# EasyEDA Pro project 模块拓展版_2026-11-20.epro

# Schematic Schematic2
Assembly Variant: Basic; Board Name: Board2; Create Date: 2026-11-12; Page Name: P1; Project Name: 拓展版; Schematic Name: Schematic2; Update Date: 2026-11-12; Company: 嘉立创EDA; Page Size: A4; Version: V1.0
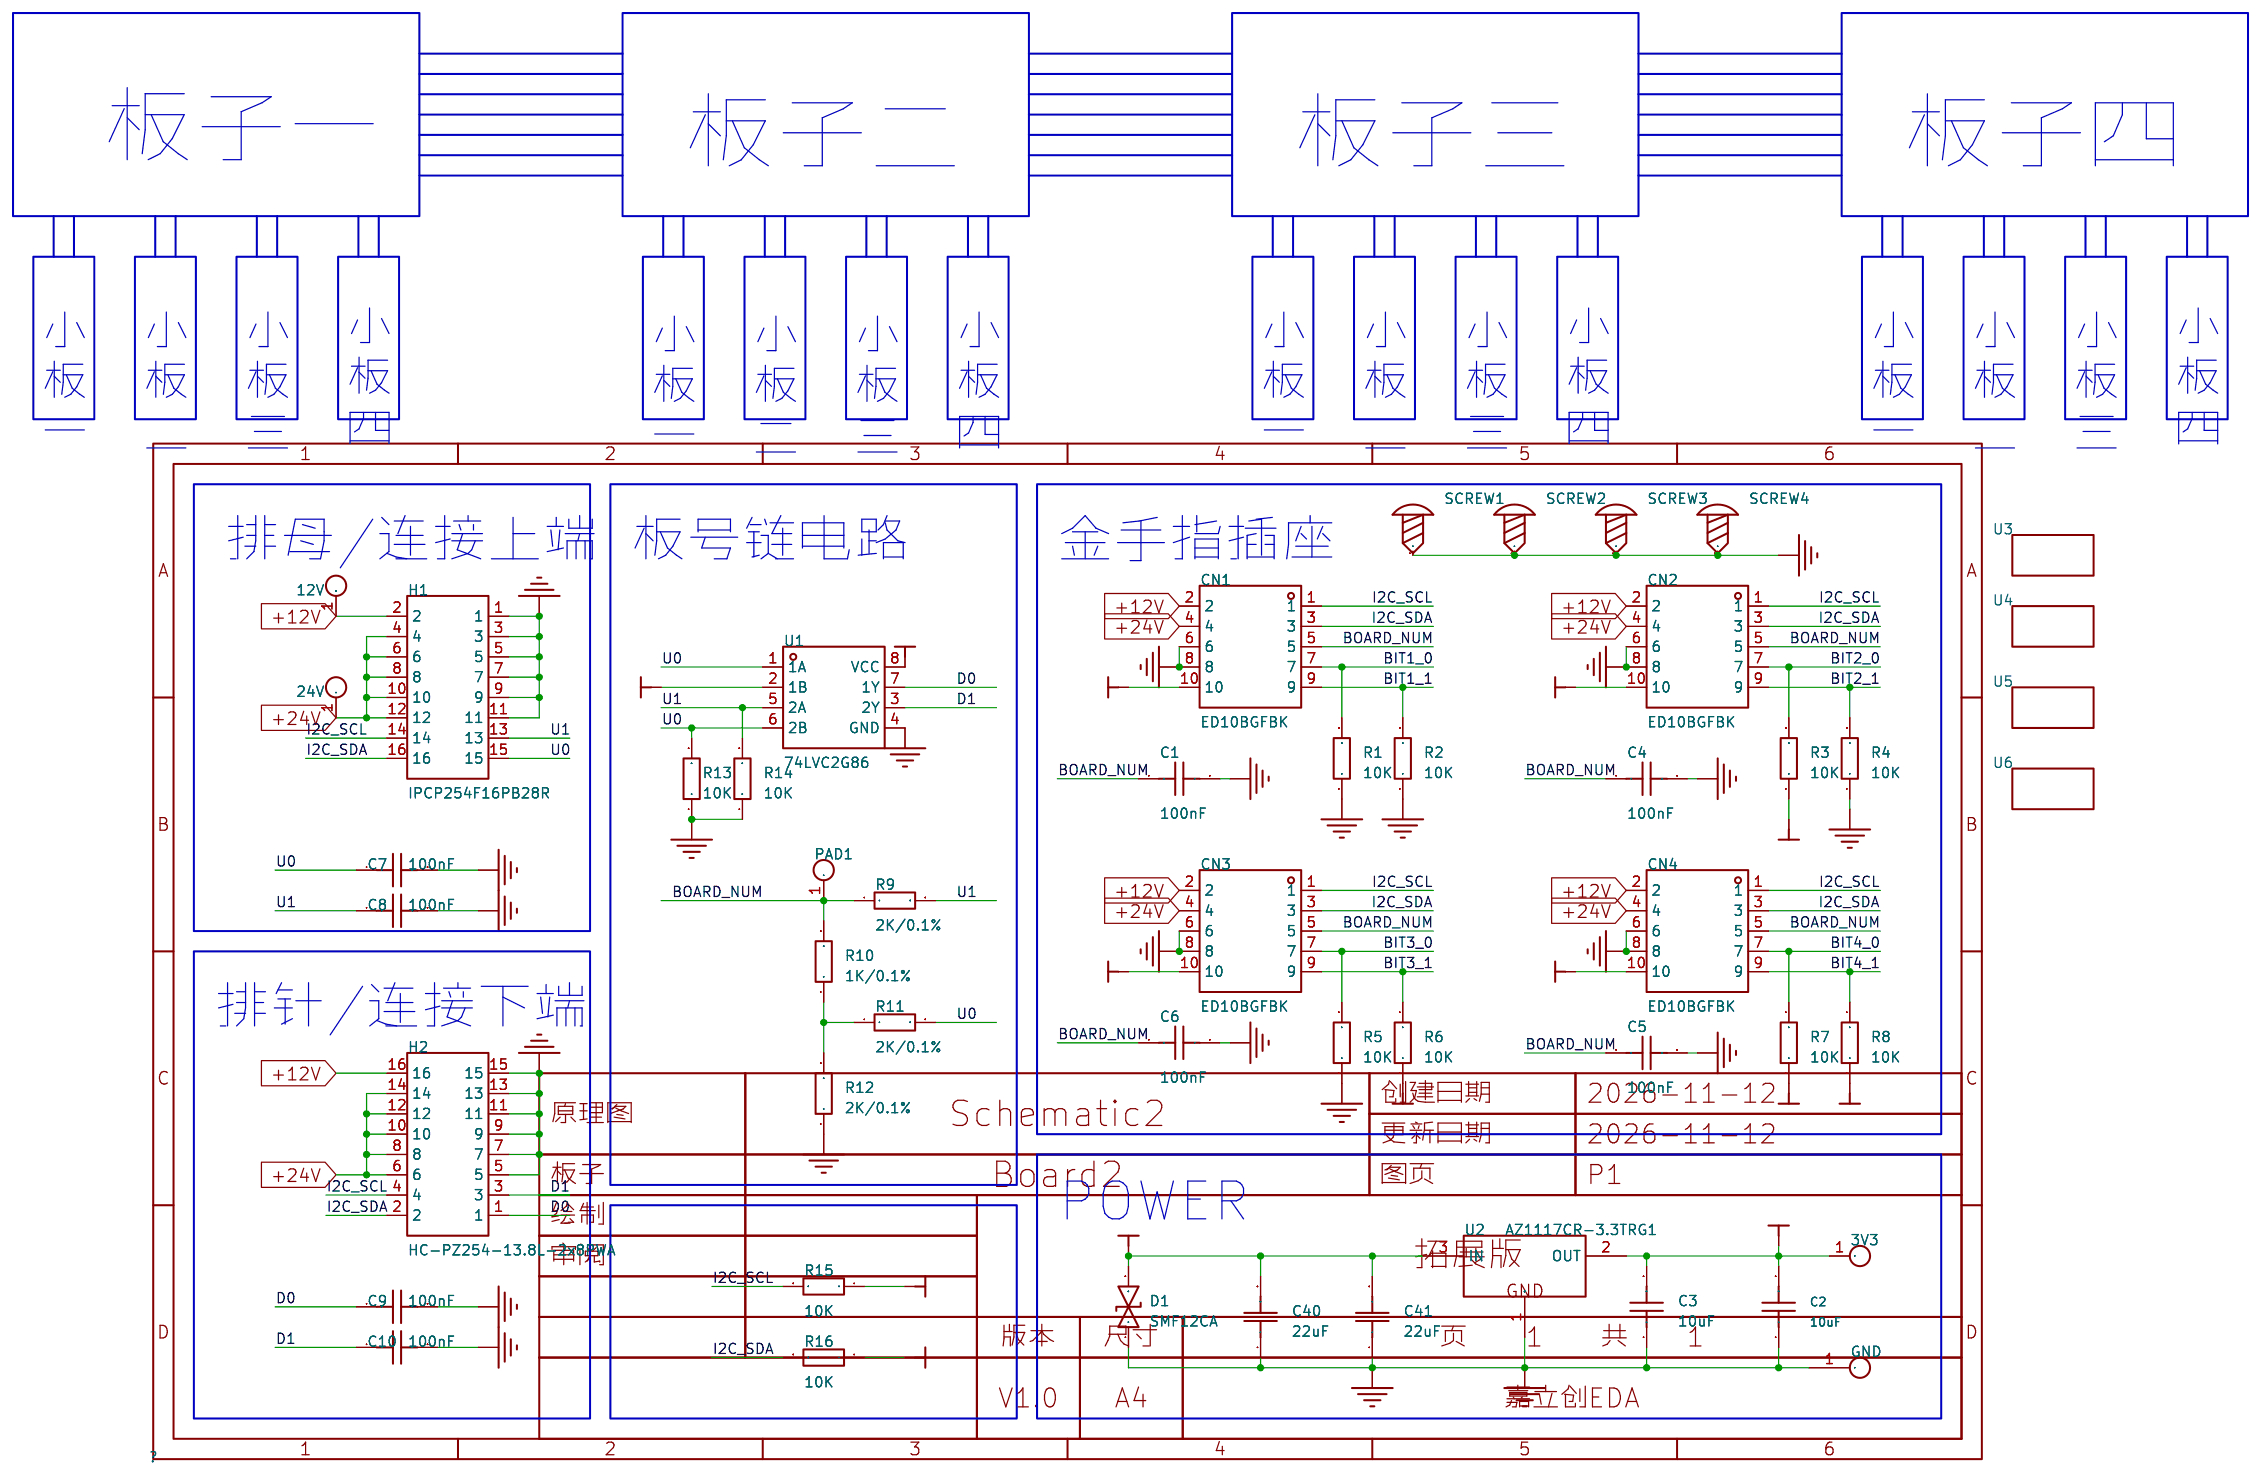
[diagram p0: schematic sheet]

## Parts
3V3  -  [test_point]
12V  -  [test_point]
24V  -  [test_point]
C1  100nF  [C1206]
C2  10uF  [C1206]
C3  10uF  [C1206]
C4  100nF  [C1206]
C5  100nF  [C1206]
C6  100nF  [C1206]
C7  100nF  [C1206]
C8  100nF  [C1206]
C9  100nF  [C1206]
C10  100nF  [C1206]
C40  22uF  [C1206]
C41  22uF  [C1206]
CN1  ED10BGFBK  [CONN-TH_10P-P2.54_ED10BGFBK]
CN2  ED10BGFBK  [CONN-TH_10P-P2.54_ED10BGFBK]
CN3  ED10BGFBK  [CONN-TH_10P-P2.54_ED10BGFBK]
CN4  ED10BGFBK  [CONN-TH_10P-P2.54_ED10BGFBK]
D1  SMF12CA  [SOD-123FL_L2.8-W1.8-LS3.7-BI]
GND  -  [test_point]
H1  IPCP254F16PB28R  [HDR-TH_16P-P2.54-H-F-R2-C8-S2.54-W10.2]
H2  HC-PZ254-13.8L-2x8PWA  [HDR-TH_16P-P2.54-V-M-R2-C8-S2.54-N13.0]
PAD1  -  [test_point]
R1  10K  [R1206]
R2  10K  [R1206]
R3  10K  [R1206]
R4  10K  [R1206]
R5  10K  [R1206]
R6  10K  [R1206]
R7  10K  [R1206]
R8  10K  [R1206]
R9  2K/0.1%  [R1206]
R10  1K/0.1%  [R1206]
R11  2K/0.1%  [R1206]
R12  2K/0.1%  [R1206]
R13  10K  [R1206]
R14  10K  [R1206]
R15  10K  [R1206]
R16  10K  [R1206]
SCREW1  -  [M3螺丝]
SCREW2  -  [M3螺丝]
SCREW3  -  [M3螺丝]
SCREW4  -  [M3螺丝]
U1  74LVC2G86  [MSOP-8_L2.9-W2.8-P0.65-LS4.0-BR]
U2  AZ1117CR-3.3TRG1  [SOT-89-3_L4.5-W2.5-P1.50-LS4.2-BR]
U3  -  [轮廓]
U4  -  [轮廓]
U5  -  [轮廓]
U6  -  [轮廓]

## Library data of the parts
3V3 12V 24V GND = 测试点: Check: false
C1 C4-C10 = CAP_0603: Supplier Footprint: 0603
C2 = CC0603KRX7R9BB104: 容值:100nF;精度:±10%;额定电压:50V;温度系数:X7R;; LCSC Part Name: 100nF ±10% 50V; Supplier Part: C14663; Manufacturer: YAGEO(国巨); Supplier Footprint: 0603; JLCPCB Part Class: Basic Part; Datasheet: https://item.szlcsc.com/datasheet/CC0603KRX7R9BB104/15331.html; Supplier: LCSC; Tolerance: ±10%; Voltage Rating: 50V; Temperature Coefficient: X7R
C3 C41 = CL10A106KP8NNNC: 容值:10uF;精度:±10%;额定电压:10V;温度系数:X5R;; LCSC Part Name: 10uF ±10% 10V; Supplier Part: C19702; Manufacturer: SAMSUNG(三星); Supplier Footprint: 0603; JLCPCB Part Class: Basic Part; Datasheet: https://item.szlcsc.com/datasheet/CL10A106KP8NNNC/20411.html; Supplier: LCSC; Tolerance: ±10%; Voltage Rating: 10V; Temperature Coefficient: X5R
C40 = CL10A226MQ8NRNC: 容值:22uF;精度:±20%;额定电压:6.3V;温度系数:X5R;; LCSC Part Name: 22uF ±20% 6.3V; Supplier Part: C59461; Manufacturer: SAMSUNG(三星); Supplier Footprint: 0603; JLCPCB Part Class: Basic Part; Datasheet: https://item.szlcsc.com/datasheet/CL10A226MQ8NRNC/60514.html; Supplier: LCSC; Tolerance: ±20%; Voltage Rating: 6.3V; Temperature Coefficient: X5R
CN1-CN4 = ED10BGFBK: 间距:2.54mm;总PIN数:10P;安装方式:直插;工作温度:-55℃~+125℃;; LCSC Part Name: 2.54mm P数:10P; Supplier Part: C5173289; Manufacturer: WingTAT(格林柏); Supplier Footprint: 插件,P=2.54mm; JLCPCB Part Class: Extended Part; Datasheet: https://item.szlcsc.com/datasheet/ED10BGFBK/5822872.html; Supplier: LCSC; Pitch: 2.54mm; Number of Pins: 10P; Mounting Type: 直插; Height Above Board: 15.6mm; Contact Material: 铜合金; Contact Plating: 金; Operating Temperature: -55℃~+125℃; Rated Current: 3A; Length: 18.99mm; Width: 9.25mm
D1 = SMF12CA_C19077507: 极性:双向;反向截止电压(Vrwm):12V;钳位电压:19.9V;峰值脉冲电流(Ipp):10.1A@10/1000us;峰值脉冲功率(Ppp):200W@10/1000us;击穿电压(VBR):14.7V;; LCSC Part Name: 双向TVS 12V截止 峰值浪涌电流：10.1A@10/1000us; Supplier Part: C19077507; Manufacturer: R+O(宏嘉诚); Supplier Footprint: SOD-123FL; JLCPCB Part Class: Extended Part; Datasheet: https://item.szlcsc.com/datasheet/SMF12CA/20275592.html; Supplier: LCSC; Polarity: 双向; Reverse Stand-Off Voltage (Vrwm): 12V; Clamping Voltage: 19.9V; Peak Pulse Current (Ipp): 10.1A@10/1000us; Peak Pulse Power Dissipation (Ppp): 200W@10/1000us; Voltage - Breakdown: 14.7V; Reverse Leakage Current (Ir): 2.5uA; Number of Channels: 单路; Operating Temperature: -55℃~+150℃; level of protection: IEC 61000-4-2; Type: TVS
H1 = IPCP254F16PB28R: 插孔结构:2x8P;间距:2.54mm;圆孔/方孔:方孔;安装方式:弯插;排数:双排;总孔位数:16P;额定电流:3A;额定电压:-;插孔方向:侧面;塑高:5mm;触头材质:黄铜;触头镀层:金;工作温度:-40℃~+105℃;; LCSC Part Name: 2x8P 间距:2.54mm 弯插; Supplier Part: C22438457; Manufacturer: INCP; Supplier Footprint: 弯插,P=2.54mm; JLCPCB Part Class: Extended Part; Datasheet: https://item.szlcsc.com/datasheet/IPCP254F16PB28R/24076646.html; Supplier: LCSC; Holes Structure: 2x8P; Pitch: 2.54mm; Circular Hole / Square Hole: 方孔; Mounting Type: 弯插; Number of Rows: 双排; Number of Positions: 16P; Current Rating: 3A; Holes Direction: 侧面; Insulation Height: 5mm; Contact Material: 黄铜; Contact Plating: 金; Operating Temperature: -40℃~+105℃
H2 = HC-PZ254-13.8L-2x8PWA: 插针结构:2x8P;间距:2.54mm;行距:2.54mm;圆针/方针:方针;安装方式:弯插;排数:双排;总PIN位数:16P;额定电流:3A;额定电压:-;配合针长度:6mm;塑高:2.5mm;端接针长度:3mm;触头材质:黄铜;触头镀层:金;工作温度:-40℃~+105℃;颜色:黑色;; LCSC Part Name: 2x8P 间距:2.54mm 方针 弯插; Supplier Part: C27985210; Manufacturer: HC(虹成电子); Supplier Footprint: 弯插,P=2.54mm; JLCPCB Part Class: Extended Part; Datasheet: https://item.szlcsc.com/datasheet/HC-PZ254-13.8L-2x8PWA/29721168.html; Supplier: LCSC; Pin Structure: 2x8P; Pitch: 2.54mm; Row Spacing: 2.54mm; Circluar Pins/Square Pins: 方针; Mounting Type: 弯插; Number of Rows: 双排; Number of Pins: 16P; Current Rating: 3A; Length of Mating Pin: 6mm; Insulation Height: 2.5mm; Length of End Connection Pin: 3mm; Contact Material: 黄铜; Contact Plating: 金; Operating Temperature: -40℃~+105℃; Color: 黑色
PAD1 = 测试点
R1-R16 = Res_0603: Supplier Footprint: 0603
SCREW1-SCREW4 = M3螺丝: Supplier Footprint: 插件
U1 = SN74LVC2G86DCUR: 逻辑类型:异或门;门电路数量:2;工作电压:1.65V~5.5V;静态电流(Iq):10uA;传播延迟(tpd):4.7ns@3.3V;; LCSC Part Name: 双通道2输入异或门; Supplier Part: C507252; Manufacturer: TI(德州仪器); Supplier Footprint: VSSOP-8; JLCPCB Part Class: Extended Part; Datasheet: https://www.ti.com/cn/lit/ds/symlink/sn74lvc2g86.pdf; Supplier: LCSC; Logic Type: 异或门; Number of Gates: 2; Voltage - Supply: 1.65V~5.5V; Quiescent Current: 10uA; Current - Output Low(IOL): 32mA; Current - Output High(IOH): 32mA; Input Logic Level - High: 2V；1.7V; Input Logic Level - Low: 800mV；700mV; Output Logic Level - High: 3.8V；1.9V；2.4V；2.3V；1.2V; Output Logic Level - Low: 300mV；400mV；450mV；550mV; Series: 74LVC; Propagation Delay: 4.7ns@3.3V; Operating Temperature: -40℃~+125℃; Inputs per Gates: 2; Features: 局部关断模式；带电插入保护；后驱动保护
U2 = AZ1117CR-3.3TRG1: 输出极性:正极;工作电压:15V;输出电压:3.3V;输出电流:800mA;电源纹波抑制比(PSRR):70dB@(120Hz);输出类型:固定;; LCSC Part Name: 3.3V 800mA 15V; Supplier Part: C460428; Manufacturer: DIODES(美台); Supplier Footprint: SOT-89; JLCPCB Part Class: Extended Part; Datasheet: https://item.szlcsc.com/datasheet/AZ1117CR-3.3TRG1/464857.html; Supplier: LCSC; Output Configuration: 正极; Voltage - Supply: 15V; Output Voltage: 3.3V; Output Current: 800mA; Power Supply Rejection Ratio (PSRR): 70dB@(120Hz); Voltage Dropout: 1.3V@(800mA); standby current: 6mA; Noise: 0.003%Vout; Features: 过流保护；热关断; Operating Temperature: -20℃~+125℃@(Tj); Output Type: 固定; Number of Outputs: 1
U3-U6 = 轮廓

## Nets
3V3: 3V3.1 C2.2 C3.2 CN1.10 CN2.10 CN3.10 CN4.10 R3.1 R6.1 R7.1 R8.1 R15.1 R16.1 U1.2(1B) U1.8(VCC) U2.2(OUT)
+12V: 12V.1 C40.2 C41.2 CN1.2 CN2.2 CN3.2 CN4.2 D1.2 H1.2 H2.16 U2.3(IN)
+24V: 24V.1 CN1.4 CN2.4 CN3.4 CN4.4 H1.4 H1.6 H1.8 H1.10 H1.12 H2.6 H2.8 H2.10 H2.12 H2.14
GND: C1.2 C2.1 C3.1 C4.2 C5.2 C6.2 C7.2 C8.2 C9.2 C10.2 C40.1 C41.1 CN1.6 CN1.8 CN2.6 CN2.8 CN3.6 CN3.8 CN4.6 CN4.8 D1.1 GND.1 H1.1 H1.3 H1.5 H1.7 H1.9 H1.11 H2.5 H2.7 H2.9 H2.11 H2.13 H2.15 R1.1 R2.1 R4.1 R5.1 R12.1 R13.1 R14.1 SCREW1.1 SCREW2.1 SCREW3.1 SCREW4.1 U1.4(GND) U2.1(GND)
BIT1_0: CN1.7 R1.2
BIT1_1: CN1.9 R2.2
BIT2_0: CN2.7 R3.2
BIT2_1: CN2.9 R4.2
BIT3_0: CN3.7 R5.2
BIT3_1: CN3.9 R6.2
BIT4_0: CN4.7 R7.2
BIT4_1: CN4.9 R8.2
BOARD_NUM: C1.1 C4.1 C5.1 C6.1 CN1.5 CN2.5 CN3.5 CN4.5 PAD1.1 R9.1 R10.2
D0: C9.1 H2.1 U1.7(1Y)
D1: C10.1 H2.3 U1.3(2Y)
I2C_SCL: CN1.1 CN2.1 CN3.1 CN4.1 H1.14 H2.4 R15.2
I2C_SDA: CN1.3 CN2.3 CN3.3 CN4.3 H1.16 H2.2 R16.2
U0: C7.1 H1.15 R11.2 R13.2 U1.1(1A) U1.6(2B)
U1: C8.1 H1.13 R9.2 R14.2 U1.5(2A)
$1N96: R10.1 R11.1 R12.2

## Notes on the sheet
- 板子一
- 板子二
- 板子三
- 板子四
- 小
  板
  一
- 小
  板
  二
- 小
  板
  三
- 小
  板
  四
- 小
  板
  一
- 小
  板
  二
- 小
  板
  三
- 小
  板
  四
- 小
  板
  一
- 小
  板
  二
- 小
  板
  三
- 小
  板
  四
- 小
  板
  一
- 小
  板
  二
- 小
  板
  三
- 小
  板
  四
- 排母/连接上端
- 板号链电路
- 金手指插座
- 排针/连接下端
- POWER

# Schematic Schematic1
Assembly Variant: Basic; Board Name: Board1; Create Date: 2026-11-12; Page Name: P1; Project Name: 拓展版; Schematic Name: Schematic1; Update Date: 2026-11-12; Company: 嘉立创EDA; Page Size: A4; Version: V1.0
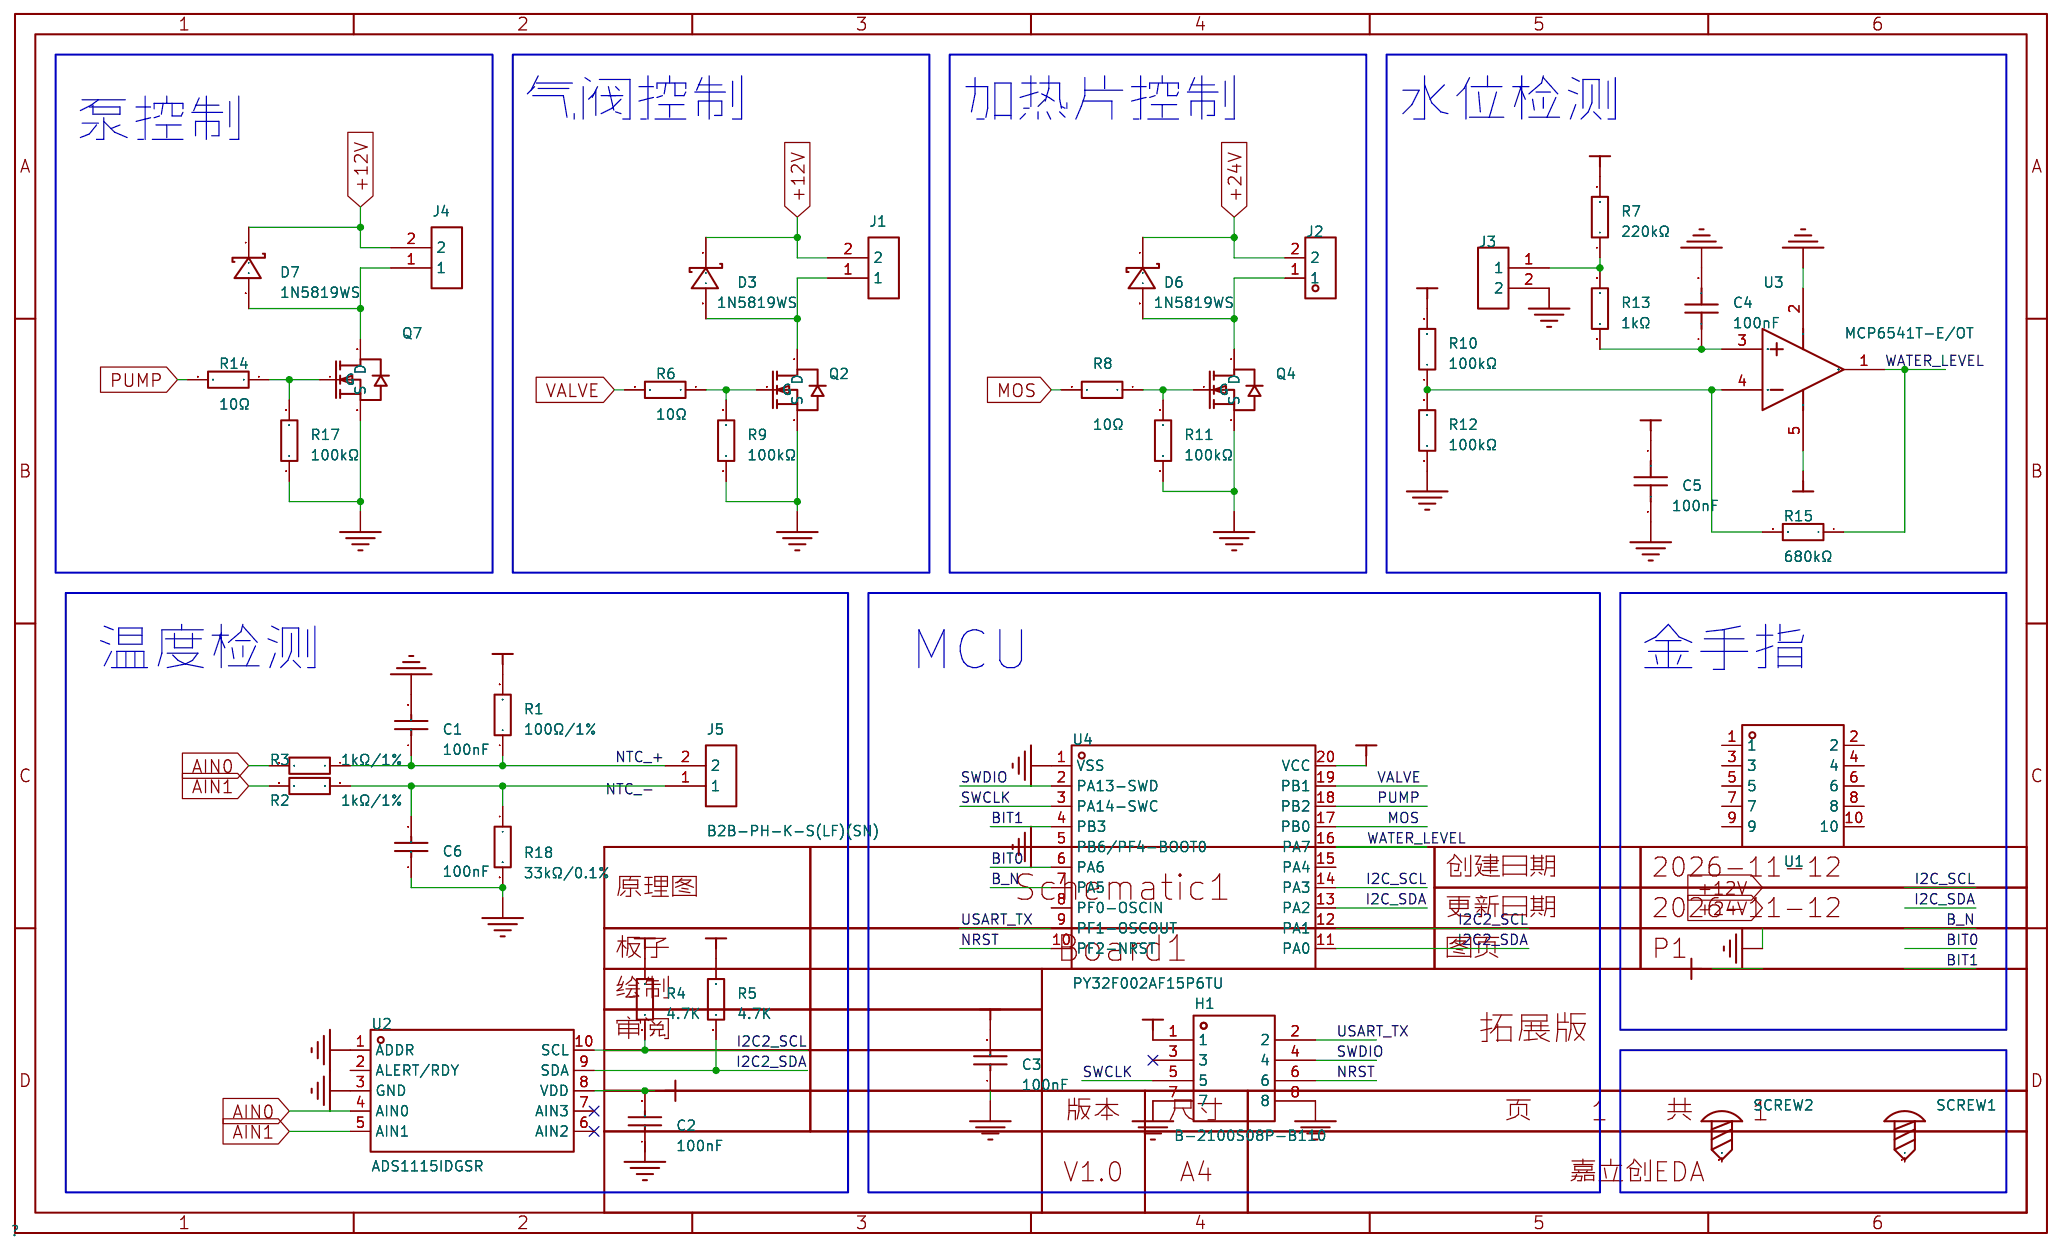
[diagram p1: schematic sheet]

## Parts
C1  100nF  [C0603]
C2  100nF  [C0603]
C3  100nF  [C0603]
C4  100nF  [C0603]
C5  100nF  [C0603]
C6  100nF  [C0603]
D3  1N5819WS  [SOD-323_L1.8-W1.3-LS2.5-RD]
D6  1N5819WS  [SOD-323_L1.8-W1.3-LS2.5-RD]
D7  1N5819WS  [SOD-323_L1.8-W1.3-LS2.5-RD]
H1  B-2100S08P-B110  [HDR-TH_8P-P2.54-V-M-R2-C4-S2.54]
J1  B2B-PH-K-S(LF)(SN)  [CONN-TH_B2B-PH-K-S]
J2  B2B-XH-A(LF)(SN)  [CONN-TH_B2B-XH-A-LF-SN]
J3  B2B-PH-K-S(LF)(SN)  [CONN-TH_B2B-PH-K-S]
J4  B2B-PH-K-S(LF)(SN)  [CONN-TH_B2B-PH-K-S]
J5  B2B-PH-K-S(LF)(SN)  [CONN-TH_B2B-PH-K-S]
Q2  -  [SOT-23-3_L2.9-W1.3-P1.90-LS2.4-BR]
Q4  -  [SOT-23-3_L2.9-W1.3-P1.90-LS2.4-BR]
Q7  -  [SOT-23-3_L2.9-W1.3-P1.90-LS2.4-BR]
R1  100Ω/1%  [R0603]
R2  1kΩ/1%  [R0603]
R3  1kΩ/1%  [R0603]
R4  4.7K  [R0603]
R5  4.7K  [R0603]
R6  10Ω  [R0603]
R7  220kΩ  [R0603]
R8  10Ω  [R0603]
R9  100kΩ  [R0603]
R10  100kΩ  [R0603]
R11  100kΩ  [R0603]
R12  100kΩ  [R0603]
R13  1kΩ  [R0603]
R14  10Ω  [R0603]
R15  680kΩ  [R0603]
R17  100kΩ  [R0603]
R18  33kΩ/0.1%  [R0603]
SCREW1  -  [M2螺丝]
SCREW2  -  [M2螺丝]
U1  -  [金手指]
U2  ADS1115IDGSR  [MSOP-10_L3.0-W3.0-P0.50-LS5.0-BL]
U3  MCP6541T-E/OT  [SOT-23-5_L2.9-W1.6-P0.95-LS2.8-BR]
U4  PY32F002AF15P6TU  [TSSOP-20_L6.5-W4.4-P0.65-LS6.4-BL]

## Library data of the parts
C1-C3 C6 = CL10B102KB8NNNC: 容值:1nF;精度:±10%;额定电压:50V;温度系数:X7R;; LCSC Part Name: 1nF ±10% 50V; Supplier Part: C1588; Manufacturer: SAMSUNG(三星); Supplier Footprint: 0603; JLCPCB Part Class: Basic Part; Datasheet: https://item.szlcsc.com/datasheet/CL10B102KB8NNNC/1940.html; Supplier: LCSC; Tolerance: ±10%; Voltage Rating: 50V; Temperature Coefficient: X7R
C4 C5 = CAP_0603: Supplier Footprint: 0603
D3 D6 D7 = 1N5819WS_C191023: 正向压降(Vf):600mV@1A;直流反向耐压(Vr):40V;整流电流:1A;; LCSC Part Name: 电压:40V 电流:1A; Supplier Part: C191023; Manufacturer: Hottech(合科泰); Supplier Footprint: SOD-323; JLCPCB Part Class: Basic Part; Datasheet: https://item.szlcsc.com/datasheet/1N5819WS/213850.html; Supplier: LCSC; Voltage - Forward(Vf@If): 600mV@1A; Voltage - DC Reverse(Vr): 40V; Current - Rectified: 1A; Non-Repetitive Peak Forward Surge Current: 25A
H1 = B-2100S08P-B110: 插针结构:2x4P;间距:2.54mm;行距:2.54mm;圆针/方针:方针;安装方式:直插;排数:双排;总PIN位数:8P;额定电流:3A;额定电压:-;配合针长度:6mm;塑高:2.54mm;端接针长度:3mm;触头材质:黄铜;触头镀层:金;工作温度:-40℃~+105℃;颜色:黑色;; LCSC Part Name: 2x4P 间距:2.54mm 方针 直插; Supplier Part: C124386; Manufacturer: Ckmtw(灿科盟); Supplier Footprint: 插件,P=2.54mm; JLCPCB Part Class: Extended Part; Datasheet: https://item.szlcsc.com/datasheet/B-2100S08P-B110/125661.html; Supplier: LCSC; Pin Structure: 2x4P; Pitch: 2.54mm; Row Spacing: 2.54mm; Circluar Pins/Square Pins: 方针; Mounting Type: 直插; Number of Rows: 双排; Number of Pins: 8P; Current Rating: 3A; Length of Mating Pin: 6mm; Insulation Height: 2.54mm; Length of End Connection Pin: 3mm; Contact Material: 黄铜; Contact Plating: 金; Operating Temperature: -40℃~+105℃; Color: 黑色
J1 J3-J5 = B2B-PH-K-S(LF)(SN): 插针结构:1x2P;间距:2mm;安装方式:直插;参考系列:PH;总PIN数:2P;排数:1;每排PIN数:2;行距:-;额定电流:2A;触头材质:黄铜;触头镀层:锡;工作温度:-25℃~+85℃;; LCSC Part Name: 1x2P 间距:2mm 直插 系列:PH; Supplier Part: C131337; Manufacturer: JST; Supplier Footprint: 插件,P=2mm; JLCPCB Part Class: Extended Part; Datasheet: https://item.szlcsc.com/datasheet/B2B-PH-K-S(LF)(SN)/142630.html; Supplier: LCSC; Pins Structure: 1x2P; Pitch: 2mm; Mounting Type: 直插; Reference Series: PH; Number of Pins: 2P; Number of Rows: 1; Number of PINs Per Row: 2; Current Rating: 2A; Contact Material: 黄铜; Contact Plating: 锡; Operating Temperature: -25℃~+85℃; Voltage Rating: 100V; Plastic Material: PA66; Flame Retardant Rating: UL94V-0; Supplementary Features: 打K脚; Color: 白色; Z-Height of the Board: 6mm; X-Length of Bottom Edge on Board (Spacing Line): 5.9mm; Y-Width of Bottom Edge on Board: 4.5mm
J2 = B2B-XH-A(LF)(SN): 插针结构:1x2P;间距:2.5mm;安装方式:直插;参考系列:XH;总PIN数:2P;排数:1;每排PIN数:2;行距:-;额定电流:3A;触头材质:黄铜;触头镀层:锡;工作温度:-25℃~+85℃;; LCSC Part Name: 1x2P 间距:2.5mm 直插 系列:XH; Supplier Part: C158012; Manufacturer: JST; Supplier Footprint: 插件,P=2.5mm; JLCPCB Part Class: Extended Part; Datasheet: https://item.szlcsc.com/datasheet/B2B-XH-A(LF)(SN)/169360.html; Supplier: LCSC; Pins Structure: 1x2P; Pitch: 2.5mm; Mounting Type: 直插; Reference Series: XH; Number of Pins: 2P; Number of Rows: 1; Number of PINs Per Row: 2; Current Rating: 3A; Contact Material: 黄铜; Contact Plating: 锡; Operating Temperature: -25℃~+85℃; Voltage Rating: 250V; Plastic Material: PA66; Flame Retardant Rating: UL94V-0; Supplementary Features: 打K脚; Color: 白色; Z-Height of the Board: 7mm; X-Length of Bottom Edge on Board (Spacing Line): 7.4mm; Y-Width of Bottom Edge on Board: 5.75mm
Q2 Q4 Q7 = AO3400A_N: 类型:N沟道;漏源电压(Vdss):30V;连续漏极电流(Id):5.2A;功率(Pd):1W;导通电阻(RDS(on)@Vgs,Id):35mΩ@10V,5A;阈值电压(Vgs(th)@Id):1.5V@250μA;; Supplier Footprint: SOT-23; Supplier Part: C700953
R1-R3 R18 = 0603WAF1002T5E: 电阻类型:厚膜电阻;阻值:10kΩ;精度:±1%;功率:100mW;工作电压:75V;温度系数:±100ppm/℃;; LCSC Part Name: 厚膜电阻 10kΩ ±1% 100mW; Supplier Part: C25804; Manufacturer: UNI-ROYAL(厚声); Supplier Footprint: 0603; JLCPCB Part Class: Basic Part; Datasheet: https://item.szlcsc.com/datasheet/0603WAF1002T5E/26547.html; Supplier: LCSC; Type: 厚膜电阻; Tolerance: ±1%; Power(Watts): 100mW; Voltage-Supply(Max): 75V; Temperature Coefficient: ±100ppm/℃; Operating Temperature: -55℃~+155℃
R4-R6 R8 R14 = 0603WAF100JT5E: 电阻类型:厚膜电阻;阻值:10Ω;精度:±1%;功率:100mW;工作电压:75V;温度系数:±400ppm/℃;; LCSC Part Name: 10Ω ±1% 100mW 厚膜电阻; Supplier Part: C22859; Manufacturer: UNI-ROYAL(厚声); Supplier Footprint: 0603; JLCPCB Part Class: Basic Part; Datasheet: https://item.szlcsc.com/datasheet/0603WAF100JT5E/23586.html; Supplier: LCSC; Type: 厚膜电阻; Tolerance: ±1%; Power(Watts): 100mW; Voltage-Supply(Max): 75V; Temperature Coefficient: ±400ppm/℃; Operating Temperature: -55℃~+155℃
R7 R9-R13 R15 R17 = 0603WAF1003T5E: 电阻类型:厚膜电阻;阻值:100kΩ;精度:±1%;功率:100mW;工作电压:75V;温度系数:±100ppm/℃;; LCSC Part Name: 100kΩ ±1% 100mW 厚膜电阻; Supplier Part: C25803; Manufacturer: UNI-ROYAL(厚声); Supplier Footprint: 0603; JLCPCB Part Class: Basic Part; Datasheet: https://item.szlcsc.com/datasheet/0603WAF1003T5E/26546.html; Supplier: LCSC; Type: 厚膜电阻; Tolerance: ±1%; Power(Watts): 100mW; Voltage-Supply(Max): 75V; Temperature Coefficient: ±100ppm/℃; Operating Temperature: -55℃~+155℃
SCREW1 SCREW2 = M2螺丝: Supplier Footprint: 插件
U1 = 金手指
U2 = ADS1115IDGSR: 分辨率(位):16;采样率:860Hz;工作电压:2V~5.5V;接口类型:I2C;; LCSC Part Name: 具有内部基准、振荡器和可编程比较器且兼容 I2C 的ADS111x、超小型、低功耗 860SPS、16位ADC; Supplier Part: C37593; Manufacturer: TI(德州仪器); Supplier Footprint: VSSOP-10; JLCPCB Part Class: Extended Part; Datasheet: https://www.ti.com/cn/lit/ds/symlink/ads1115.pdf; Supplier: LCSC; Resolution (Bits): 16; Sampling Rate: 860Hz; number of channels: 4; Voltage - Supply: 2V~5.5V; Interface: I2C; differential input: 是; Integral non - linearity: 1LSB; Operating Temperature: -40℃~+125℃; Clock/Oscillator: 内置; Voltage Reference: 内置; Programmable Gain: 支持; ADC architecture: Sigma-Delta; Quiescent Current (Iq): 500nA; Features: 集成调制器；多路复用器；内置数字滤波器；上电复位
U3 = MCP6541T-E/OT: 比较器数:单路;输入失调电压(Vos):1.5mV;输入偏置电流(Ib):1pA;轨到轨:轨到轨输入;; LCSC Part Name: 推挽输出微安级比较器; Supplier Part: C2980237; Manufacturer: MICROCHIP(美国微芯); Supplier Footprint: SOT-23-5; JLCPCB Part Class: Extended Part; Datasheet: https://item.szlcsc.com/datasheet/MCP6541T-E%252FOT/3401304.html; Supplier: LCSC; Number of Channels: 单路; Vos - Input Offset Voltage: 1.5mV; Ib - Input Bias Current: 1pA; Propagation Delay Time: 4us; Input Hysteresis Voltage (Vhys): 3.3mV; Common Mode Rejection Ratio(CMRR): 70dB; Output Type: 推挽; Output Mode: CMOS；TTL; Rail to Rail: 轨到轨输入; Quiescent Current: 600nA; Operating Temperature: -40℃~+85℃; Single Supply: 1.6V~5.5V; Input Offset Voltage Drift(Vos TC): 3uV/℃; Input Offset Current(Ios): 1pA; Response Time (tr): 0.85us; Features: 内置迟滞；ESD保护
U4 = PY32F002AF15P6TU: CPU内核:ARM Cortex-M0+;CPU最大主频:24MHz;CPU位数:32 Bit;; LCSC Part Name: 32位微控制器 单片机  PY32F002AF15P6TU; Supplier Part: C5292059; Manufacturer: PUYA(普冉); Supplier Footprint: TSSOP-20; JLCPCB Part Class: Extended Part; Datasheet: https://item.szlcsc.com/datasheet/PY32F002AF15P6TU/6036160.html; Supplier: LCSC; CPU Core: ARM Cortex-M0+; CPU Maximum Speed: 24MHz; Core Size: 32 Bit; Program Storage Size: 20KB; Program Memory Type: FLASH; RAM Size: 3KB; Number of I/O: 18; ADC (Bit): 12bit; Oscillator Type: 内置+外置; Voltage - Supply: 1.7V~5.5V; Operating Temperature: -40℃~+85℃

## Nets
3V3: C2.2 C3.2 C5.1 R1.2 R4.1 R5.1 R7.2 R10.2 U2.8(VDD) U3.5(VDD) U4.20(VCC)
+12V: D3.1(K) D7.1(K) J1.2 J4.2
+24V: D6.1(K) J2.2
GND: C1.2 C2.1 C3.1 C4.2 C5.2 C6.1 H1.7 H1.8 J3.2 Q2.2(S) Q4.2(S) Q7.2(S) R9.1 R11.1 R12.1 R17.1 R18.2 U2.1(ADDR) U2.3(GND) U3.2(VSS) U4.1(VSS) U4.5(PB6/PF4-BOOT0)
VDD: H1.1
AIN0: R3.2 U2.4(AIN0)
AIN1: R2.2 U2.5(AIN1)
B_N: U4.7(PA5)
BIT0: U4.6(PA6)
BIT1: U4.4(PB3)
I2C2_SCL: R4.2 U2.10(SCL) U4.12(PA1)
I2C2_SDA: R5.2 U2.9(SDA) U4.11(PA0)
I2C_SCL: U4.14(PA3)
I2C_SDA: U4.13(PA2)
MOS: R8.2 U4.17(PB0)
NRST: H1.6 U4.10(PF2-NRST)
NTC_+: C1.1 J5.2 R1.1 R3.1
NTC_-: C6.2 J5.1 R2.1 R18.1
PUMP: R14.2 U4.18(PB2)
SWCLK: H1.5 U4.3(PA14-SWC)
SWDIO: H1.4 U4.2(PA13-SWD)
USART_TX: H1.2 U4.9(PF1-OSCOUT)
VALVE: R6.2 U4.19(PB1)
WATER_LEVEL: R15.1 U3.1(OUT) U4.16(PA7)
$1N3: Q7.1(G) R14.1 R17.2
$1N4: D7.2(A) J4.1 Q7.3(D)
$1N8: Q2.1(G) R6.1 R9.2
$1N9: D3.2(A) J1.1 Q2.3(D)
$1N13: Q4.1(G) R8.1 R11.2
$1N14: D6.2(A) J2.1 Q4.3(D)
$1N37: J3.1 R7.1 R13.2
$1N125: R10.1 R12.2 R15.2 U3.4(VIN-)
$1N128: C4.1 R13.1 U3.3(VIN+)

Not connected (* = marked no-connect by the designer): H1 3*; SCREW1 1; SCREW2 1; U1 1 2 3 4 5 6 7 8 9 10; U2 2(ALERT/RDY) 6(AIN2)* 7(AIN3)*; U4 8(PF0-OSCIN) 15(PA4)

## Notes on the sheet
- 气阀控制
- 加热片控制
- 水位检测
- 泵控制
- 温度检测
- MCU
- 金手指

# Board PCB1
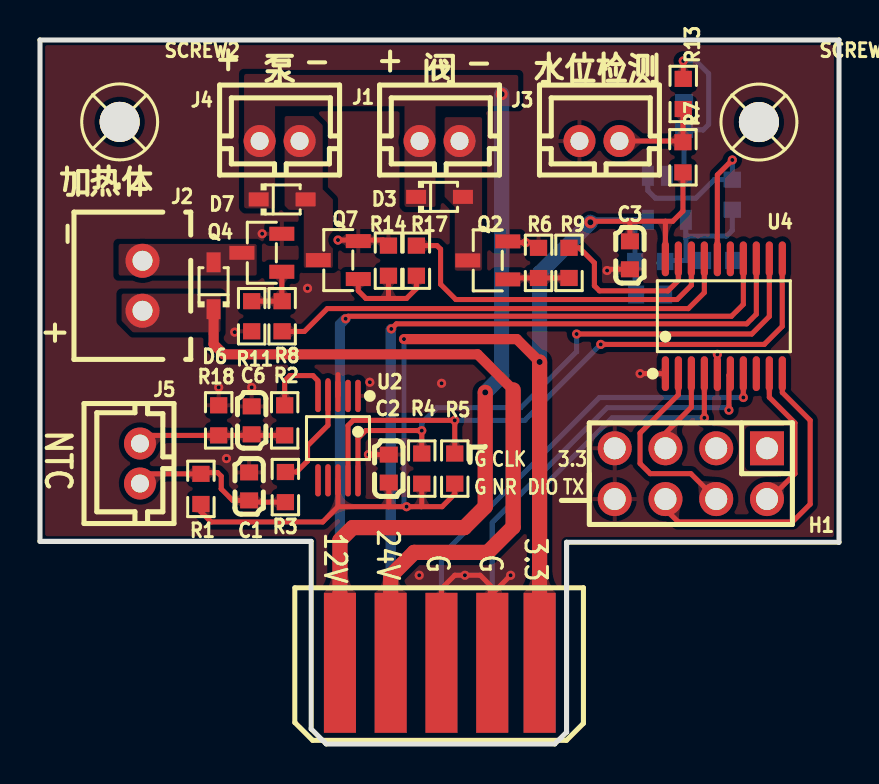
[diagram p2: board, top side]
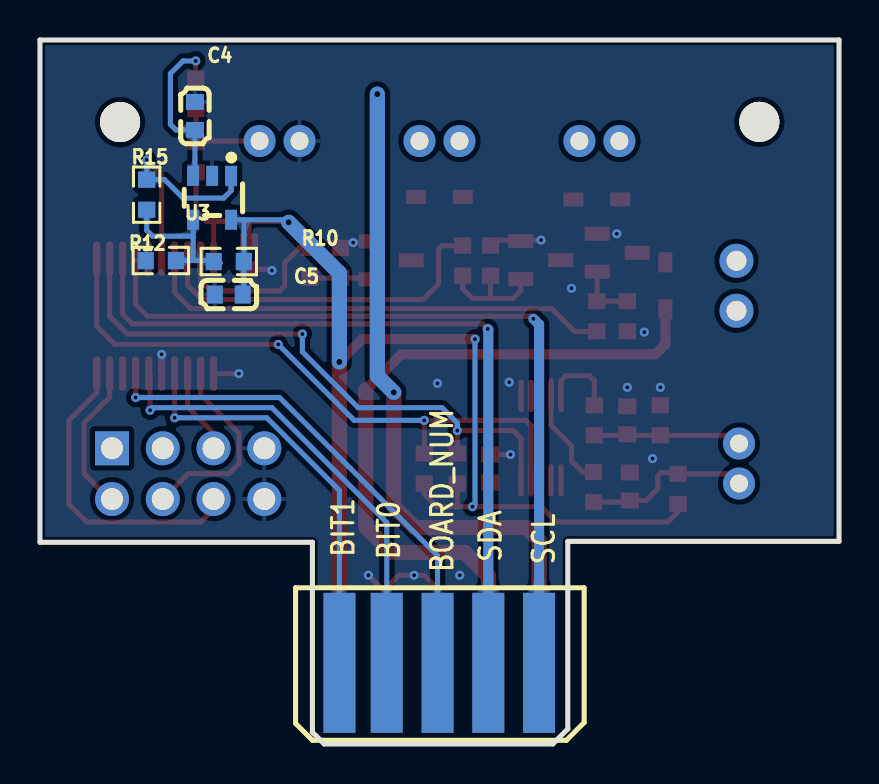
[diagram p3: board, bottom side, seen from below]

Outline 39.97 x 35.21 mm; copper layers: Top Layer, Bottom Layer. Coordinates in mm from the lower left corner of the outline.
Outline path: 0,35.21 39.97,35.21 39.97,10.09 26.35,10.09 26.35,0.59 25.75,0 14.32,0 13.57,0.76 13.57,10.14 0,10.14 0,35.21
Stack: Top Layer 0.035mm / Dielectric1 1.51mm FR4 er 4.5 / Bottom Layer 0.035mm

## Design rules (mm)
spacing copperThickness1oz (default): track to track 0.102, other pairs 0.102 to 0.3
spacing copperThickness2oz: track to track 0.203, other pairs 0.152 to 0.3
track width copperThickness1oz (default): min 0.127, default 0.254, max 2.54
track width copperThickness2oz: min 0.203, default 0.254, max 2.54
differential pair differentialPair (default): width min 0.127, default 0.254, max 2.54; gap min 0.152, default 0.152
net GND uses copperRegion
net $1N4 uses copperRegion
pour e4222 uses PWR_default, default
net +12V uses copperRegion
net $1N9 uses copperRegion
net $1N14 uses copperRegion
pour e4224 uses PWR_default, default
pour e4226 uses PWR_default, default
pour e4228 uses PWR_default, default
pour e4230 uses PWR_default, default
pour e4232 uses PWR_default, default
pour e4468 uses PWR_copperThickness1oz

## Placement (name value [footprint] x y rotation side)
C1  100nF  [C0603]  10.46 12.89 90 top
C2  100nF  [C0603]  17.45 13.77 270 top
C3  100nF  [C0603]  29.51 24.44 90 top
C4  100nF  [C0603]  32.22 31.41 90 bottom
C5  100nF  [C0603]  30.53 22.48 0 bottom
C6  100nF  [C0603]  10.59 16.19 270 top
D3  1N5819WS  [SOD-323_L1.8-W1.3-LS2.5-RD]  19.99 27.36 0 top
D6  1N5819WS  [SOD-323_L1.8-W1.3-LS2.5-RD]  8.69 22.92 90 top
D7  1N5819WS  [SOD-323_L1.8-W1.3-LS2.5-RD]  12.11 27.24 0 top
H1  B-2100S08P-B110  [HDR-TH_8P-P2.54-V-M-R2-C4-S2.54]  32.56 13.52 180 top
J1  B2B-PH-K-S(LF)(SN)  [CONN-TH_B2B-PH-K-S]  19.99 30.16 0 top
J2  B2B-XH-A(LF)(SN)  [CONN-TH_B2B-XH-A-LF-SN]  5.13 22.92 90 top
J3  B2B-PH-K-S(LF)(SN)  [CONN-TH_B2B-PH-K-S]  27.99 30.16 0 top
J4  B2B-PH-K-S(LF)(SN)  [CONN-TH_B2B-PH-K-S]  11.99 30.16 0 top
J5  B2B-PH-K-S(LF)(SN)  [CONN-TH_B2B-PH-K-S]  5 14.03 90 top
Q2  -  [SOT-23-3_L2.9-W1.3-P1.90-LS2.4-BR]  22.4 24.19 0 top
Q4  -  [SOT-23-3_L2.9-W1.3-P1.90-LS2.4-BR]  11.1 24.57 0 top
Q7  -  [SOT-23-3_L2.9-W1.3-P1.90-LS2.4-BR]  14.92 24.2 0 top
R1  100Ω/1%  [R0603]  8.05 12.76 270 top
R2  1kΩ/1%  [R0603]  12.24 16.19 90 top
R3  1kΩ/1%  [R0603]  12.28 12.85 90 top
R4  4.7K  [R0603]  19.1 13.77 90 top
R5  4.7K  [R0603]  20.75 13.77 90 top
R6  10Ω  [R0603]  26.47 24.06 90 top
R7  220kΩ  [R0603]  32.17 29.34 270 top
R8  10Ω  [R0603]  12.11 21.39 270 top
R9  100kΩ  [R0603]  24.94 24.06 270 top
R10  100kΩ  [R0603]  30.53 24.13 180 bottom
R11  100kΩ  [R0603]  10.59 21.39 90 top
R12  100kΩ  [R0603]  33.93 24.18 180 bottom
R13  1kΩ  [R0603]  32.18 32.51 270 top
R14  10Ω  [R0603]  18.83 24.17 90 top
R15  680kΩ  [R0603]  34.64 27.47 270 bottom
R17  100kΩ  [R0603]  17.43 24.17 270 top
R18  33kΩ/0.1%  [R0603]  8.94 16.19 90 top
SCREW1  -  [M2螺丝]  35.97 31.11 180 top
SCREW2  -  [M2螺丝]  3.99 31.11 180 top
U1  -  [金手指]  12.75 0.19 0 top
U2  ADS1115IDGSR  [MSOP-10_L3.0-W3.0-P0.50-LS5.0-BL]  14.91 15.3 180 top
U3  MCP6541T-E/OT  [SOT-23-5_L2.9-W1.6-P0.95-LS2.8-BR]  31.36 27.32 90 bottom
U4  PY32F002AF15P6TU  [TSSOP-20_L6.5-W4.4-P0.65-LS6.4-BL]  34.21 21.39 0 top

## Footprints (pads in the part's own frame, mm; a bottom-side part is the same pattern mirrored in y, then rotated)
C0603
  rect 0.8x0.9 smd: 1(-0.7,0) 2(0.7,0)
CONN-TH_B2B-PH-K-S
  round 1.6 hole 0.9: 1(1,0) 2(-1,0)
CONN-TH_B2B-XH-A-LF-SN
  round 1.7 hole 1: 1(1.25,0) 2(-1.25,0)
HDR-TH_8P-P2.54-V-M-R2-C4-S2.54
  rect 1.7x1.7 hole 1.1: 1(-3.81,-1.27)
  round 1.7 hole 1.1: 2(-3.81,1.27) 3(-1.27,-1.27) 4(-1.27,1.27) 5(1.27,-1.27) 6(1.27,1.27) 7(3.81,-1.27) 8(3.81,1.27)
M2螺丝
  round 2 hole 2: 1(0,0)
MSOP-10_L3.0-W3.0-P0.50-LS5.0-BL
  oval 0.28x1.62 smd: 1(-1,-2.11) 2(-0.5,-2.11) 3(0,-2.11) 4(0.5,-2.11) 5(1,-2.11) 6(1,2.11) 7(0.5,2.11) 8(0,2.11) 9(-0.5,2.11) 10(-1,2.11)
R0603
  rect 0.806x0.864 smd: 1(-0.753,0) 2(0.753,0)
SOD-323_L1.8-W1.3-LS2.5-RD
  rect 1x0.7 smd: 1(-1.173,0) 2(1.173,0)
SOT-23-3_L2.9-W1.3-P1.90-LS2.4-BR
  rect 1.25x0.7 smd: 1(1,-0.95) 2(1,0.95) 3(-1,0)
SOT-23-5_L2.9-W1.6-P0.95-LS2.8-BR
  rect 1x0.6 smd: 1(1.1,-0.95) 2(1.1,0) 3(1.1,0.95) 4(-1.1,0.95) 5(-1.1,-0.95)
TSSOP-20_L6.5-W4.4-P0.65-LS6.4-BL
  oval 0.364x1.742 smd: 1(-2.925,-2.871) 2(-2.275,-2.871) 3(-1.625,-2.871) 4(-0.975,-2.871) 5(-0.325,-2.871) 6(0.325,-2.871) 7(0.975,-2.871) 8(1.625,-2.871) 9(2.275,-2.871) 10(2.925,-2.871) 11(2.925,2.871) 12(2.275,2.871) 13(1.625,2.871) 14(0.975,2.871) 15(0.325,2.871) 16(-0.325,2.871) 17(-0.975,2.871) 18(-1.625,2.871) 19(-2.275,2.871) 20(-2.925,2.871)
金手指
  rect 1.6x7 smd: 1(2.256,3.876) 3(4.796,3.876) 5(7.336,3.876) 7(9.876,3.876) 9(12.246,3.876)
  rect 1.6x7 smd far side: 2(2.256,3.876) 4(4.796,3.876) 6(7.336,3.876) 8(9.876,3.876) 10(12.246,3.876)

## Nets
3V3: C2.2 C3.2 C5.1 R1.2 R4.1 R5.1 R7.2 R10.2 U1.9 U2.8 U3.5 U4.20
+12V: D3.1 D7.1 J1.2 J4.2 U1.1
+24V: D6.1 J2.2 U1.3
GND: C1.2 C2.1 C3.1 C4.2 C5.2 C6.1 H1.7 H1.8 J3.2 Q2.2 Q4.2 Q7.2 R9.1 R11.1 R12.1 R17.1 R18.2 U1.5 U1.7 U2.1 U2.3 U3.2 U4.1 U4.5
VDD: H1.1
AIN0: R3.2 U2.4
AIN1: R2.2 U2.5
B_N: U1.6 U4.7
BIT0: U1.8 U4.6
BIT1: U1.10 U4.4
I2C2_SCL: R4.2 U2.10 U4.12
I2C2_SDA: R5.2 U2.9 U4.11
I2C_SCL: U1.2 U4.14
I2C_SDA: U1.4 U4.13
MOS: R8.2 U4.17
NRST: H1.6 U4.10
NTC_+: C1.1 J5.2 R1.1 R3.1
NTC_-: C6.2 J5.1 R2.1 R18.1
PUMP: R14.2 U4.18
SWCLK: H1.5 U4.3
SWDIO: H1.4 U4.2
USART_TX: H1.2 U4.9
VALVE: R6.2 U4.19
WATER_LEVEL: R15.1 U3.1 U4.16
$1N3: Q7.1 R14.1 R17.2
$1N4: D7.2 J4.1 Q7.3
$1N8: Q2.1 R6.1 R9.2
$1N9: D3.2 J1.1 Q2.3
$1N13: Q4.1 R8.1 R11.2
$1N14: D6.2 J2.1 Q4.3
$1N37: J3.1 R7.1 R13.2
$1N125: R10.1 R12.2 R15.2 U3.4
$1N128: C4.1 R13.1 U3.3

Pads without a net: H1 3; SCREW1 1; SCREW2 1; U2 2 6 7; U4 8 15

## Via types
v1: diameter 0.457, hole 0.203, Top Layer to Bottom Layer, 30 vias
v2: diameter 0.61, hole 0.305, Top Layer to Bottom Layer, 4 vias

## Routing (per net, layer and track width the routed paths; a pad name or vN(x,y) marks a point on that pad's centre or on a via; arc(x,y) is an arc through that point)
3V3: length 73.1
  Top Layer w0.254: 19.08,11.87 19.1,11.89 R4.1 ; 19.08,11.87 20.12,11.87 20.75,12.5 R5.1 ; 19.08,11.87 v1(18.34,11.87) 17.44,11.87 ; 31.29,26.14 31.66,26.14 32.17,26.65 R7.2 ; 31.29,26.14 U4.20 ; 31.29,26.14 29.53,26.14 ; 17.44,11.87 14.91,11.87 ; 17.44,11.87 17.45,11.88 C2.2 ; R1.2 8.05,11.62 8.56,11.11 14.15,11.11 14.91,11.87 ; 29.51,25.14 29.51,26.13 29.53,26.14 ; U2.8 14.91,11.87 ; 29.53,26.14 27.59,26.14 v2(27.54,26.09)
  Top Layer w0.508: v2(25,19.11) 23.85,20.25 v1(18.21,20.25)
  Top Layer w0.762: U1.9 v2(25,19.11)
  Bottom Layer w0.254: 29.77,26.22 27.66,26.22 ; 29.77,26.22 U3.5 ; 29.77,26.22 29.77,24.14 R10.2 29.78,22.53 C5.1 ; v1(18.21,20.25) 18.21,12 v1(18.34,11.87)
  Bottom Layer w0.762: v2(27.54,26.09) 25,23.55 v2(25,19.11)
+12V: length 35.1
  Top Layer w0.762: U1.1 15.01,10.19 15.64,10.82 21.23,10.82 22.28,11.87 v2(22.28,17.58)
  Bottom Layer w0.762: v2(23.1,32.5) 23.1,18.41 v2(22.28,17.58)
+24V: length 36
  Top Layer w0.508: D6.1 8.69,20 9.19,19.49 21.89,19.49 23.67,17.71
  Top Layer w0.762: U1.3 17.55,8.41 18.72,9.58 22.4,9.58 23.67,10.85 23.67,17.71
GND: length 25.1
  Top Layer w0.254: 17.45,14.47 v1(16.43,14.47) ; v1(28.37,23.68) 28.43,23.74 C3.1 ; U4.1 v1(30.02,18.52) ; U2.3 14.91,18.47 ; R9.1 24.68,25.08 v1(24.31,25.08) 23.46,25.08 Q2.2 ; U4.5 v1(33.89,19.49) ; R17.1 17.16,25.2 v1(14.91,25.2) ; U1.5 20.09,7.78 20.75,8.44 v1(21.26,8.44) 22.02,8.44 22.53,7.93 22.53,4.16 U1.7 22.63,7.52 v1(23.54,8.44)
  vias: v1(8.94,17.84) v1(9.33,14.28) v1(9.74,20.6) v1(10.59,17.84) v1(11.12,25.52) v1(13.38,22.79) v1(16.5,18.09) v1(18.97,8.44) v1(20.09,18.04)
AIN0: length 5.8
  Top Layer w0.254: 14.41,18.17 14.41,15.94 13.38,14.92 13.38,14.16 12.83,13.6 R3.2
AIN1: length 3.1
  Top Layer w0.254: R2.2 12.24,18.17 12.5,18.42 13.66,18.42 13.91,18.17
B_N: length 24.9
  Top Layer w0.254: U4.7 v1(35.19,17.33)
  Bottom Layer w0.254: U1.6 20.09,9.43 27.99,17.33 v1(35.19,17.33)
BIT0: length 23.1
  Top Layer w0.254: U4.6 34.47,18.45 v1(34.47,16.7)
  Bottom Layer w0.254: U1.8 22.63,11.08 28.37,16.82 34.34,16.82 v1(34.47,16.7)
BIT1: length 20.6
  Top Layer w0.254: U4.4 v1(33.24,16.31)
  Bottom Layer w0.254: U1.10 25,12.69 28.62,16.31 v1(33.24,16.31)
I2C2_SCL: length 29.2
  Top Layer w0.254: U4.12 36.49,21.38 35.61,20.51 v1(26.85,20.51) ; 15.91,13.95 15.91,15.29 16.3,15.68 19.09,15.68 v1(19.1,15.67) R4.2
  Bottom Layer w0.254: v1(26.85,20.51) 26.85,19.62 24.05,16.82 19.86,16.82 19.1,16.06 v1(19.1,15.67)
I2C2_SDA: length 30.8
  Top Layer w0.254: 15.41,13.95 15.41,15.92 15.67,16.19 v1(20.75,16.19) R5.2 ; U4.11 37.13,24.26 37.13,20.89 36.23,19.98 v1(28.05,19.98)
  Bottom Layer w0.254: v1(20.75,16.19) 24.26,16.19 v1(28.05,19.98)
I2C_SCL: length 39.8
  Top Layer w0.254: v1(15.29,21.27) 15.42,21.39 34.59,21.39 35.19,21.99 U4.14
  Bottom Layer w0.508: v1(15.29,21.27) 15.01,20.98 U1.2
I2C_SDA: length 38
  Top Layer w0.254: U4.13 35.84,21.5 35.36,21.01 17.83,21.01 v1(17.58,20.76)
  Bottom Layer w0.508: U1.4 17.55,20.73 v1(17.58,20.76)
MOS: length 23.6
  Top Layer w0.254: U4.17 33.24,22.58 32.44,21.78 14.37,21.78 13.23,20.63 12.12,20.63 R8.2
NRST: length 15
  Top Layer w0.254: U4.10 37.14,17.58 38.53,16.19 38.53,12 37.64,11.11 31.93,11.11 31.29,11.74
NTC_+: length 8.5
  Top Layer w0.254: R3.1 10.55,12.1 C1.1 9.64,12.19 9.07,12.76 9.07,13.39 8.89,13.57 8.11,13.57 R1.1 5.49,13.51 J5.2
NTC_-: length 7.4
  Top Layer w0.254: R2.1 R18.1 5.41,15.43 J5.1
PUMP: length 17.5
  Top Layer w0.254: U4.18 32.59,22.94 31.87,22.23 20.8,22.23 20.04,22.99 20.04,24.75 19.86,24.93 R14.2
SWCLK: length 3.5
  Top Layer w0.254: U4.3 32.59,16.85 31.29,15.55
SWDIO: length 9.8
  Top Layer w0.254: 33.83,12.25 32.56,13.52 30.53,13.52 30.02,14.03 30.02,15.55 31.94,17.47 U4.2
USART_TX: length 7.5
  Top Layer w0.254: 36.37,12.25 36.69,12.57 36.82,12.57 37.77,13.52 37.77,16.06 36.49,17.34 U4.9
VALVE: length 8.3
  Top Layer w0.254: U4.19 31.94,23.18 31.42,22.66 27.99,22.66 27.74,22.92 27.74,24.06 26.98,24.81 R6.2
WATER_LEVEL: length 11.7
  Top Layer w0.254: U4.16 33.89,28.46 v1(34.64,29.21)
  Bottom Layer w0.254: v1(34.64,29.21) R15.1 33.74,28.23 32.82,27.3 30.78,27.3 30.41,27.68 U3.1
$1N3: length 5.6
  Top Layer w0.254: R14.1 18.83,22.78 18.34,22.28 17.42,22.28 ; 17.42,22.28 17.43,22.3 R17.2 ; 17.42,22.28 16.31,22.28 15.92,22.67 Q7.1
$1N8: length 3.1
  Top Layer w0.254: 23.4,23.24 23.47,23.31 26.47,23.31
$1N13: length 3
  Top Layer w0.254: R11.2 R8.1 12.1,22.16 Q4.1
$1N37: length 4.9
  Top Layer w0.254: J3.1 32.1,30.16 R7.1 32.17,31.74 R13.2
$1N125: length 7.8
  Bottom Layer w0.254: U3.4 32.31,25.31 ; 32.31,25.31 32.4,25.4 34.34,25.4 34.64,25.7 R15.2 ; 32.31,25.31 32.31,24.23 32.36,24.18 ; 32.36,24.18 31.08,24.18 30.95,24.05 ; 32.36,24.18 R12.2
$1N128: length 8.6
  Top Layer w0.254: v1(32.18,34.16) R13.1
  Bottom Layer w0.254: v1(32.18,34.16) 32.82,34.16 33.45,33.53 33.45,30.99 33.17,30.71 C4.1 32.22,28.51 U3.3

## Copper pours and planes (outline as drawn; the poured copper is in the pictures)
+12V on Top Layer: 10.28,26.79 10.21,26.86 10.21,33.51 11.76,33.51 11.76,26.79
+12V on Top Layer: 18.31,26.86 18.24,26.93 18.24,33.33 19.79,33.33 19.79,26.86
+12V on Top Layer: 23.93,31.9 10.22,31.9 10.22,33.46 23.93,33.46
+24V on Top Layer: 9.03,20.59 4.65,20.59 4.08,21.16 4.08,22.52 9.03,22.52
GND on Top Layer: 40.44,0.06 -2.49,0.06 -2.49,36.63 40.44,36.63
GND on Bottom Layer: 42.98,-1.34 -2.74,-1.34 -2.74,37.9 42.98,37.9
$1N4 on Top Layer: 14.66,23.81 13.21,23.81 13.2,23.82 13.2,26.72 12.78,26.72 12.71,26.79 12.71,27.74 14.15,27.74 14.66,27.24
$1N4 on Top Layer: 14.15,30.94 14.15,26.72 14.15,26.72 12.45,26.72 12.24,26.93 12.24,31.41 13.68,31.41
$1N9 on Top Layer: 20.75,23.68 20.75,26.86 20.24,27.36 20.24,31.35 22.12,31.35 22.12,23.67 20.76,23.67
$1N14 on Top Layer: 10.84,23.43 3.93,23.43 3.93,25.01 10.84,25.01

Small or netless copper shapes (teardrops, artwork), in the pictures only: 115 on Top Layer, 34 on Bottom Layer

## Text on the board
Bottom Silkscreen Layer: SCL | SDA | BOARD_NUM | BIT0 | BIT1
Top Silkscreen Layer: G | CLK | NR | DIO | 3.3 | TX | 12V | 24V | - | + | NTC | 加热体 | 泵 | 阀 | 水位检测

# Board PCB2
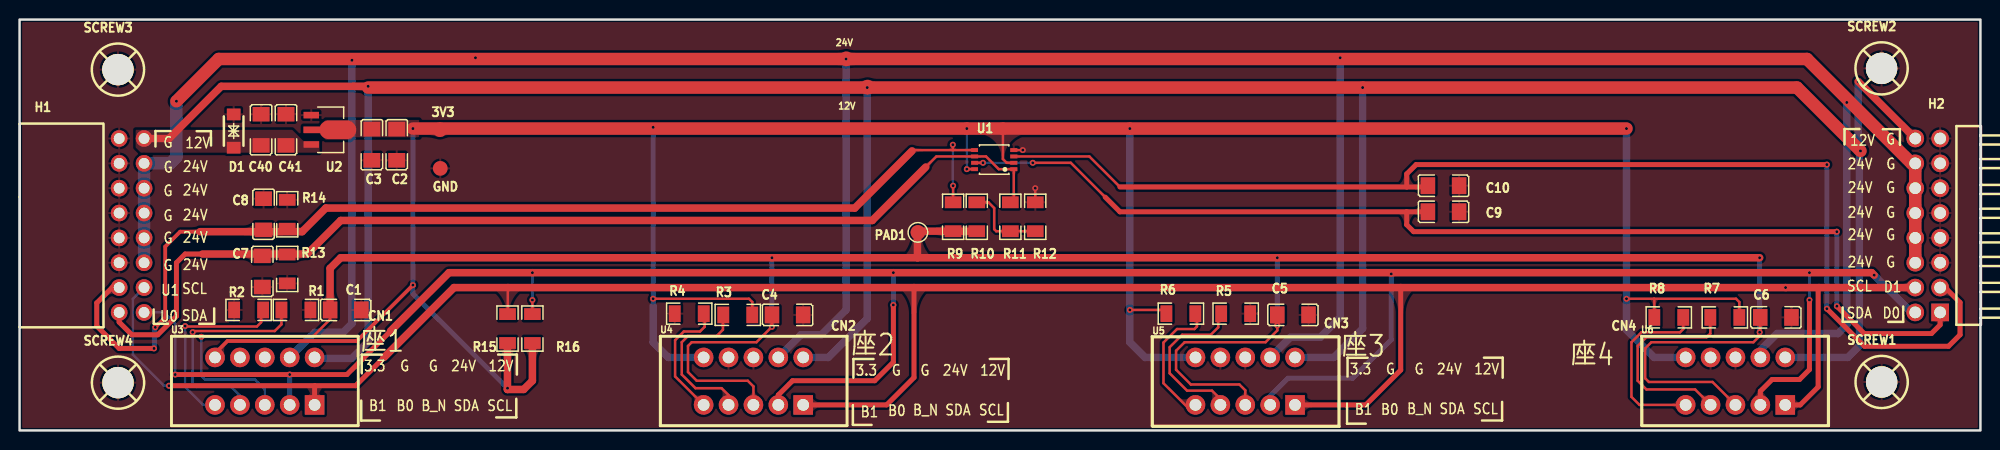
[diagram p4: board, top side]
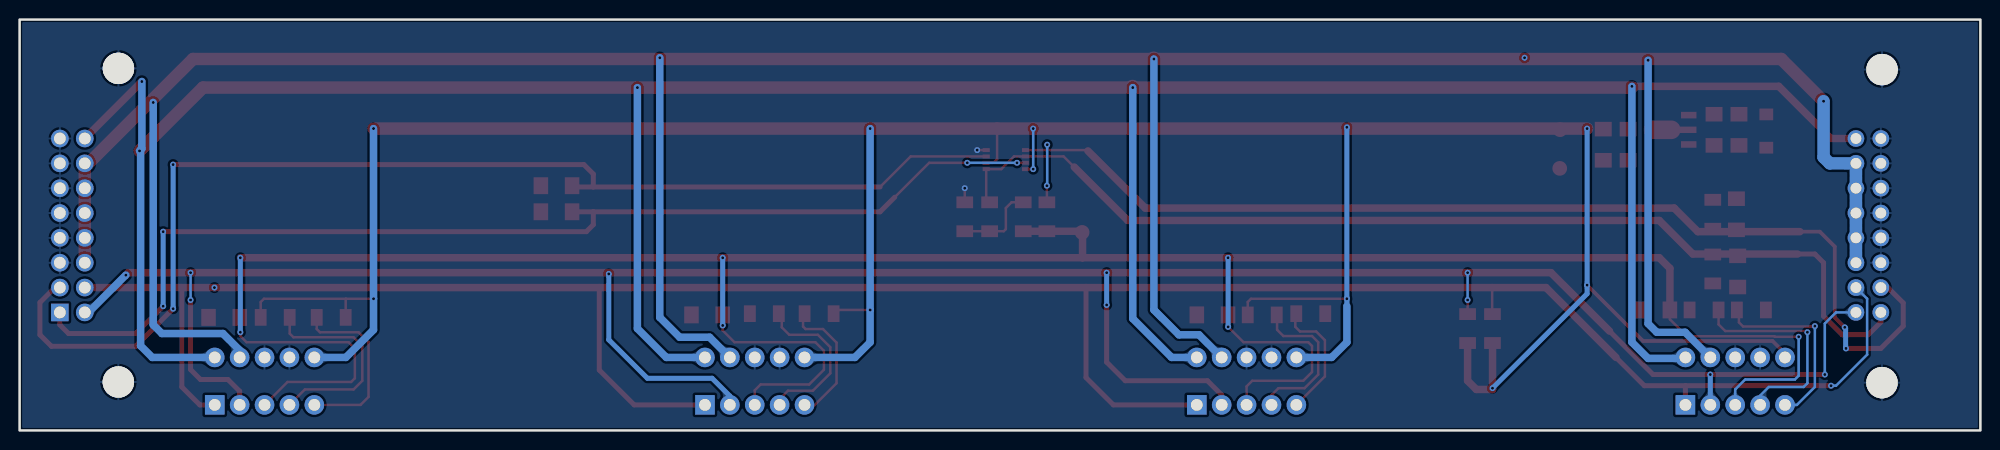
[diagram p5: board, bottom side, seen from below]

Outline 200.07 x 42 mm; copper layers: Top Layer, Bottom Layer. Coordinates in mm from the lower left corner of the outline.
Outline path: rectangle 0,42 200.07,0
Stack: Top Layer 0.035mm / Dielectric1 1.51mm FR4 er 4.5 / Bottom Layer 0.035mm

## Design rules (mm)
spacing copperThickness1oz (default): track to track 0.102, other pairs 0.152 to 0.3
spacing copperThickness2oz: track to track 0.203, other pairs 0.152 to 0.3
track width copperThickness1oz (default): min 0.127, default 0.254, max 2.54
track width copperThickness2oz: min 0.203, default 0.254, max 2.54
differential pair differentialPair (default): width min 0.127, default 0.254, max 2.54; gap min 0.152, default 0.152
net +12V uses copperRegion
net +24V uses copperRegion
net GND uses copperRegion
net 3V3 uses copperRegion
pour e9748 uses PWR
pour e10369 uses PWR

## Placement (name value [footprint] x y rotation side)
3V3  -  [test_point]  42.89 30.75 0 top
12V  -  [test_point]  86.52 35.1 180 top
24V  -  [test_point]  84.36 37.99 180 top
C1  100nF  [C1206]  33.27 12.32 0 top
C2  10uF  [C1206]  38.48 29.21 90 top
C3  10uF  [C1206]  35.94 29.21 90 top
C4  100nF  [C1206]  78.36 11.81 0 top
C5  100nF  [C1206]  129.92 11.81 0 top
C6  100nF  [C1206]  179.2 11.56 0 top
C7  100nF  [C1206]  24.76 16.26 270 top
C8  100nF  [C1206]  24.89 22.1 90 top
C9  100nF  [C1206]  145.29 22.35 0 top
C10  100nF  [C1206]  145.29 25.02 0 top
C40  22uF  [C1206]  24.64 30.73 270 top
C41  22uF  [C1206]  27.18 30.73 270 top
CN1  ED10BGFBK  [CONN-TH_10P-P2.54_ED10BGFBK]  25.02 5.04 180 top
CN2  ED10BGFBK  [CONN-TH_10P-P2.54_ED10BGFBK]  74.87 5.04 180 top
CN3  ED10BGFBK  [CONN-TH_10P-P2.54_ED10BGFBK]  125.06 5.04 180 top
CN4  ED10BGFBK  [CONN-TH_10P-P2.54_ED10BGFBK]  175.08 5.04 180 top
D1  SMF12CA  [SOD-123FL_L2.8-W1.8-LS3.7-BI]  21.84 30.61 270 top
GND  -  [test_point]  42.92 26.79 0 top
H1  IPCP254F16PB28R  [HDR-TH_16P-P2.54-H-F-R2-C8-S2.54-W10.2]  11.43 20.95 270 top
H2  HC-PZ254-13.8L-2x8PWA  [HDR-TH_16P-P2.54-V-M-R2-C8-S2.54-N13.0]  194.69 20.95 90 top
PAD1  -  [test_point]  91.66 20.25 0 top
R1  10K  [R1206]  28.19 12.32 180 top
R2  10K  [R1206]  23.37 12.32 0 top
R3  10K  [R1206]  73.28 11.81 180 top
R4  10K  [R1206]  68.33 11.94 0 top
R5  10K  [R1206]  124.08 11.94 180 top
R6  10K  [R1206]  118.49 11.94 0 top
R7  10K  [R1206]  173.99 11.56 180 top
R8  10K  [R1206]  168.28 11.56 0 top
R9  2K/0.1%  [R1206]  95.25 21.84 90 top
R10  1K/0.1%  [R1206]  97.66 21.84 270 top
R11  2K/0.1%  [R1206]  101.09 21.84 90 top
R12  2K/0.1%  [R1206]  103.63 21.84 270 top
R13  10K  [R1206]  27.3 16.51 90 top
R14  10K  [R1206]  27.3 22.1 270 top
R15  10K  [R1206]  49.78 10.41 90 top
R16  10K  [R1206]  52.32 10.41 90 top
SCREW1  -  [M3螺丝]  189.99 4.95 0 top
SCREW2  -  [M3螺丝]  189.99 37.02 0 top
SCREW3  -  [M3螺丝]  10.03 36.89 0 top
SCREW4  -  [M3螺丝]  10.04 4.88 0 top
U1  74LVC2G86  [MSOP-8_L2.9-W2.8-P0.65-LS4.0-BR]  99.44 27.69 0 top
U2  AZ1117CR-3.3TRG1  [SOT-89-3_L4.5-W2.5-P1.50-LS4.2-BR]  31.12 30.73 180 top
U3  -  [轮廓]  25.02 5.08 0 top
U4  -  [轮廓]  74.93 5.08 0 top
U5  -  [轮廓]  125.14 4.96 0 top
U6  -  [轮廓]  175.01 5.08 0 top

## Footprints (pads in the part's own frame, mm; a bottom-side part is the same pattern mirrored in y, then rotated)
C1206
  rect 1.485x1.728 smd: 1(-1.593,0) 2(1.593,0)
CONN-TH_10P-P2.54_ED10BGFBK
  rect 2x2 hole 1.2: 1(-5.08,2.425)
  round 2 hole 1.2: 2(-5.08,-2.425) 3(-2.54,2.425) 4(-2.54,-2.425) 5(0,2.425) 6(0,-2.425) 7(2.54,2.425) 8(2.54,-2.425) 9(5.08,2.425) 10(5.08,-2.425)
HDR-TH_16P-P2.54-H-F-R2-C8-S2.54-W10.2
  round 1.7 hole 1.1: 1(-8.89,-1.27) 2(-8.89,1.27) 3(-6.35,-1.27) 4(-6.35,1.27) 5(-3.81,-1.27) 6(-3.81,1.27) 7(-1.27,-1.27) 8(-1.27,1.27) 9(1.27,-1.27) 10(1.27,1.27) 11(3.81,-1.27) 12(3.81,1.27) 13(6.35,-1.27) 14(6.35,1.27) 15(8.89,-1.27) 16(8.89,1.27)
HDR-TH_16P-P2.54-V-M-R2-C8-S2.54-N13.0
  rect 1.8x1.8 hole 1.2: 1(-8.89,-1.27)
  round 1.8 hole 1.2: 2(-8.89,1.27) 3(-6.35,-1.27) 4(-6.35,1.27) 5(-3.81,-1.27) 6(-3.81,1.27) 7(-1.27,-1.27) 8(-1.27,1.27) 9(1.27,-1.27) 10(1.27,1.27) 11(3.81,-1.27) 12(3.81,1.27) 13(6.35,-1.27) 14(6.35,1.27) 15(8.89,-1.27) 16(8.89,1.27)
M3螺丝
  round 3.2 hole 3.2: 1(0,0)
MSOP-8_L2.9-W2.8-P0.65-LS4.0-BR
  rect 0.73x0.4 smd: 1(2,-0.975) 2(2,-0.325) 3(2,0.325) 4(2,0.975)
  rect 0.7x0.4 smd: 5(-2,0.976) 6(-2,0.325) 7(-2,-0.325) 8(-2,-0.976)
R1206
  rect 1.208x1.701 smd: 1(-1.479,0) 2(1.479,0)
SOD-123FL_L2.8-W1.8-LS3.7-BI
  rect 1.2x1.4 smd: 1(-1.7,0) 2(1.7,0)
SOT-89-3_L4.5-W2.5-P1.50-LS4.2-BR
  rect 1.575x0.672 smd: 1(1.356,-1.5) 3(1.356,1.5)
  custom 5.377x1.9 smd: 2(-1.356,0)
test_point
  round 1.5 smd: 1(0,0)

## Nets
As in the schematic.

## Via types
v1: diameter 0.61, hole 0.305, Top Layer to Bottom Layer, 55 vias

## Routing (per net, layer and track width the routed paths; a pad name or vN(x,y) marks a point on that pad's centre or on a via; arc(x,y) is an arc through that point)
3V3: length 314.4
  Top Layer w0.254: 100.33,31.11 100.33,27.74 100.71,27.36 U1.2 ; 166.77,13.46 v1(163.96,13.46) ; 166.77,13.46 175.13,13.46 175.47,13.13 R7.1 ; 166.77,13.46 166.8,13.44 R8.1 ; R6.1 116.63,12.32 v1(113.28,12.32) ; U1.8 v1(96.65,26.71) ; 74.76,11.81 74.76,13.13 74.42,13.46 v1(64.64,13.46)
  Top Layer w0.381: v1(40.13,14.86) 34.42,9.14 21.21,9.14 19.94,7.87 CN1.10
  Top Layer w0.762: 49.78,4.19 49.78,8.93 49.78,8.94 ; 49.78,4.19 49.78,4.2 v1(49.78,4.32) ; 49.78,4.19 51.43,4.19 52.32,5.08 52.32,8.94
  Top Layer w1.27: v1(40.13,30.86) v1(96.65,30.86) v1(113.28,30.86) v1(163.96,30.86)
  Bottom Layer w0.254: v1(96.65,26.71) v1(96.65,30.86)
  Bottom Layer w0.508: v1(49.78,4.32) 40.13,13.97 v1(40.13,14.86) v1(40.13,30.86) ; 64.64,12.7 v1(64.64,13.46) v1(64.64,30.99)
  Bottom Layer w0.762: 64.64,12.7 64.64,9.02 66.2,7.46 CN2.10 ; CN4.10 166.78,7.46 163.96,10.29 v1(163.96,13.46) v1(163.96,30.86) ; CN3.10 114.84,7.46 113.28,9.02 v1(113.28,12.32) v1(113.28,30.86)
+12V: length 320.4
  Top Layer w0.762: H2.16 v1(187.6,35.67) ; 12.7,29.84 15.24,29.84 20.57,35.18 v1(35.56,35.18)
  Top Layer w1.27: v1(187.83,28.57) 181.36,35.05 v1(137.03,35.05) v1(86.49,35.05) 35.56,35.05
  Bottom Layer w0.762: CN4.2 186.53,7.46 187.72,8.65 187.72,28.69 ; v1(187.6,35.67) 187.6,28.81 187.72,28.69 ; 187.72,28.69 v1(187.83,28.57) ; v1(35.56,35.18) 35.56,9.02 33.91,7.37 30.1,7.37 ; v1(137.03,35.05) 137.03,10.41 134.08,7.46 CN3.2 ; CN2.2 82.52,7.46 86.49,11.43 v1(86.49,35.05)
+24V: length 351.4
  Top Layer w1.27: v1(16,33.65) 20.32,37.97 v1(84.33,37.97) 182.37,37.97 193.04,27.3 H2.14 H2.12 H2.10 H2.8 H2.6 193.49,17.07
  Bottom Layer w0.762: CN1.4 30.13,10.03 33.02,10.03 33.91,10.92 v1(33.91,37.85) ; v1(84.33,37.97) 84.33,12.32 81.79,9.78 79.73,9.78 CN2.4 ; CN3.4 129.66,9.52 132.72,9.52 134.75,11.56 v1(134.75,38.1) ; v1(186.44,33.53) 186.44,10.79 185.55,9.91 179.32,9.91 177.62,8.2 CN4.4
  Bottom Layer w1.27: v1(16,33.65) 16,27.94 15.37,27.3 12.7,27.3 12.7,17.14
  vias: v1(46.51,38.1)
GND: length 2.4
  Top Layer w0.254: R12.1 v1(103.63,24.77) ; U1.4 v1(102.36,28.66)
BIT1_0: length 22.4
  Top Layer w0.254: v1(17.65,10.04) 17.77,10.16 26.04,10.16 26.71,10.84 R1.2
  Bottom Layer w0.254: v1(17.65,10.04) 17.65,4.83 18.03,4.44 21.59,4.44 22.48,3.56 CN1.7
BIT1_1: length 19.3
  Top Layer w0.254: v1(16.89,10.67) 16.94,10.62 24.21,10.62 24.64,11.05 24.64,12.11 R2.2
  Bottom Layer w0.254: v1(16.89,10.67) 16.89,4.44 18.72,2.61 CN1.9
BIT2_0: length 16.7
  Top Layer w0.254: CN2.7 72.33,3.61 71.63,4.32 68.96,4.32 67.56,5.71 67.56,9.02 68.2,9.65 71.12,9.65 71.76,10.3 71.76,12.32
BIT2_1: length 13.2
  Top Layer w0.254: 69.84,12.32 69.9,12.26 69.9,10.59 69.42,10.11 67.77,10.11 66.88,9.23 66.88,5.52 CN2.9
BIT3_0: length 16.8
  Top Layer w0.254: R5.2 122.3,11.64 122.3,10.54 121.54,9.78 118.62,9.78 117.35,8.51 117.35,5.84 119.13,4.06 121.67,4.06 122.52,3.21 CN3.7
BIT3_1: length 13.8
  Top Layer w0.254: 120.02,1.88 119.66,1.88 116.71,4.83 116.71,8.98 118.1,10.37 119.88,10.37 120.13,10.62 120.13,11.52 120.07,11.58
BIT4_0: length 21.6
  Top Layer w0.254: R7.2 172.51,9.91 172.13,9.52 165.99,9.52 165.1,8.64 165.1,5.08 165.99,4.19 170.96,4.19 CN4.7
BIT4_1: length 18.5
  Top Layer w0.254: 169.75,11.56 169.75,10.37 169.42,10.03 165.48,10.03 164.47,9.02 164.47,3.43 165.28,2.61 CN4.9
BOARD_NUM: length 282.9
  Top Layer w0.254: v1(128.33,10.73) 128.33,10.22 127.13,9.02 118.87,9.02 118,8.14 118,6.21 119.51,4.7 124.46,4.7 125.06,4.1 CN3.5 ; CN4.5 172.74,4.95 166.24,4.95 165.86,5.33 165.86,8.38 166.5,9.02 176.91,9.02 177.55,9.65 v1(177.55,10.03) 177.6,10.09 C6.1 ; v1(18.54,9.58) 20.96,9.58 21.01,9.63 29.95,9.63 31.68,11.36 C1.1 ; CN2.5 74.87,4.5 74.29,5.08 69.09,5.08 68.2,5.97 68.2,8.64 68.58,9.02 75.18,9.02 v1(76.76,10.59) 76.76,12.32
  Top Layer w0.508: C5.1 v1(128.33,10.73)
  Top Layer w0.762: 91.61,17.65 91.61,20.2 PAD1.1 91.78,20.37 R9.1 R10.2 ; 91.61,17.65 v1(128.33,17.65) v1(177.55,17.65) ; 91.61,17.65 v1(76.77,17.65) 32.76,17.65 31.68,16.57 C1.1
  Bottom Layer w0.254: v1(18.54,9.58) 18.54,5.59 18.92,5.21 24,5.21 25.02,4.19 CN1.5
  Bottom Layer w0.508: v1(76.77,17.65) 76.76,17.64 v1(76.76,10.59) ; v1(177.55,10.03) v1(177.55,17.65) ; v1(128.33,10.73) v1(128.33,17.65)
D0: length 114.7
  Top Layer w0.254: 110.74,23.88 107.26,27.36 v1(103.38,27.36) ; U1.7 v1(98.3,27.36)
  Top Layer w0.508: 141.53,22.35 112.27,22.35 110.78,23.84 ; 141.53,22.35 141.53,21.03 142.24,20.32 v1(185.42,20.32) ; 141.53,22.35 C9.1 ; v1(185.42,12.7) 188.21,9.91 195.07,9.91 195.96,10.79 H2.1
  Bottom Layer w0.254: v1(98.3,27.36) v1(103.38,27.36)
  Bottom Layer w0.508: v1(185.42,12.7) v1(185.42,20.32)
D1: length 124.6
  Top Layer w0.254: U1.3 109.15,28.01 112.27,24.89
  Top Layer w0.508: v1(184.4,12.45) 188.25,8.6 196.82,8.6 197.99,9.78 197.99,13.08 196.47,14.6 H2.3 ; 141.53,24.89 141.53,26.22 142.49,27.18 v1(184.4,27.18) ; 141.53,24.89 112.27,24.89 ; 141.53,24.89 143.57,24.89 C10.1
  Bottom Layer w0.508: v1(184.4,12.45) v1(184.4,27.18)
I2C_SCL: length 256
  Top Layer w0.254: 49.82,14.6 49.82,11.93 R15.2
  Top Layer w0.508: 140.92,14.6 140.92,6.17 137.36,2.61 CN3.1 ; CN4.1 181.68,2.61 183.52,4.44 183.52,14.52 183.6,14.6 ; CN2.1 88.46,2.61 91.26,5.41 91.26,14.6 ; CN1.1 30.1,4.57 ; 30.1,4.57 v1(15.24,4.57) ; 30.1,4.57 34.29,4.57 37.18,7.46
  Top Layer w0.762: 37.18,7.46 44.32,14.6 v1(180.19,14.6) H2.4
  Bottom Layer w0.254: v1(15.24,4.57) 14.73,4.57 11.56,7.75 11.56,13.46 12.7,14.6
I2C_SDA: length 262.6
  Top Layer w0.254: R16.2 v1(52.32,13.33)
  Top Layer w0.508: CN4.3 177.62,4.01 178.82,5.21 181.61,5.21 182.63,6.22 v1(182.63,13.33) ; 37.85,10.16 33.4,5.71 v1(27.56,5.71) v1(15.87,5.71) ; v1(89.15,12.83) 89.15,6.98 87.25,5.08 78.87,5.08 77.41,3.63 CN2.3
  Top Layer w0.762: v1(189.23,15.88) 188.98,16.13 v1(182.63,16.13) v1(89.15,16.13) v1(52.32,16.13) 43.82,16.13 37.85,10.16
  Bottom Layer w0.254: v1(182.63,13.33) v1(182.63,16.13) ; v1(15.87,5.71) 15.87,10.92 14.73,12.06 12.7,12.06 ; v1(52.32,13.33) v1(52.32,16.13)
  Bottom Layer w0.508: CN3.3 127.6,3.52 129.41,5.33 136.02,5.33 139.95,9.27 v1(139.95,16) ; v1(27.56,5.71) CN1.3 ; v1(89.15,12.83) v1(89.15,16.13)
  Bottom Layer w0.762: H2.2 193.04,12.06 v1(189.23,15.88)
U0: length 107.6
  Top Layer w0.254: R11.2 101.44,23.67 101.44,26.71 99.91,26.71 98.61,28.01 U1.6 93.54,28.01 92.46,26.92
  Top Layer w0.508: H1.15 10.16,11.07 11.45,9.78 14.1,9.78 16,11.68 16,17.14 16.89,18.03 18.67,18.03
  Top Layer w0.762: 92.46,26.92 87,21.46 32.77,21.46 29.34,18.03 18.67,18.03
U1: length 116.2
  Top Layer w0.254: 95.22,28.66 91.15,28.66 ; 95.22,28.66 v1(95.22,29.21) ; 95.22,28.66 U1.5 ; 95.46,23.31 95.25,23.31 v1(95.25,25.02)
  Top Layer w0.381: v1(13.84,10.54) 14.86,11.56 14.86,18.8 16.38,20.32 18.41,20.32
  Top Layer w0.508: v1(13.72,8.38) 10.16,8.38 7.87,10.67 7.87,13.04 9.44,14.6 H1.13
  Top Layer w0.762: 18.41,20.32 28.83,20.32 31.24,22.73 85.22,22.73 91.06,28.57
  Bottom Layer w0.254: v1(95.25,25.02) 95.22,25.05 v1(95.22,29.21)
  Bottom Layer w0.508: v1(13.84,10.54) 13.75,10.45 13.75,8.42 v1(13.72,8.38)
$1N96: length 8.6
  Top Layer w0.254: R10.1 98.85,23.32 99.44,22.73 99.44,20.57 99.65,20.37 R11.1 R12.2 103.76,20.49

## Copper pours and planes (outline as drawn; the poured copper is in the pictures)
3V3 on Top Layer: 28.96,31.11 30.61,31.11 31.24,31.75 40.77,31.75 40.77,29.97 34.04,29.97 33.78,29.72 31.24,29.72 30.61,30.35 28.94,30.35 28.94,31.1
+12V on Top Layer: 11.84,28.92 11.84,30.73 27.81,30.73 28.94,29.61 30.61,29.61 30.61,28.45 30.56,28.4 12.37,28.4
GND on Top Layer: -22.73,60.71 214,60.71 214,-19.56 -22.73,-19.56
GND on Bottom Layer: -16.26,58.93 204.09,58.93 204.09,-10.41 -16.26,-10.41

Small or netless copper shapes (teardrops, artwork), in the pictures only: 141 on Top Layer, 68 on Bottom Layer

## Text on the board
Top Silkscreen Layer: U0 | U1 | G | SDA | SCL | 24V | 12V | 3.3 | B1 | B0 | B_N | D0 | D1 | 座1 | 座2 | 座3 | 座4
